# EasyEDA Pro project realtix-sakura_nfc-d968f2f9.epro, board PCB5
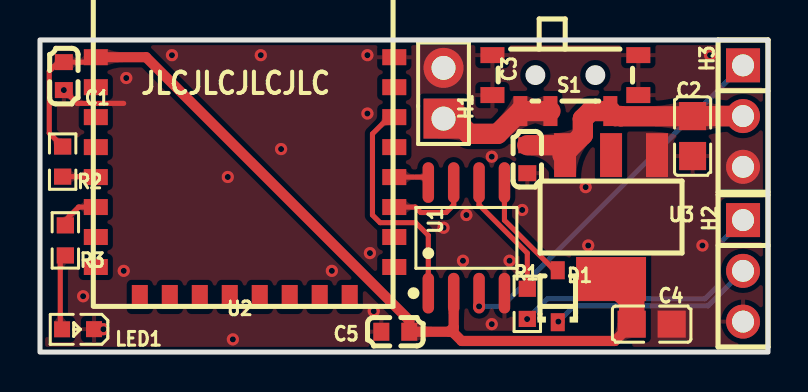
[diagram p10: board, top side]
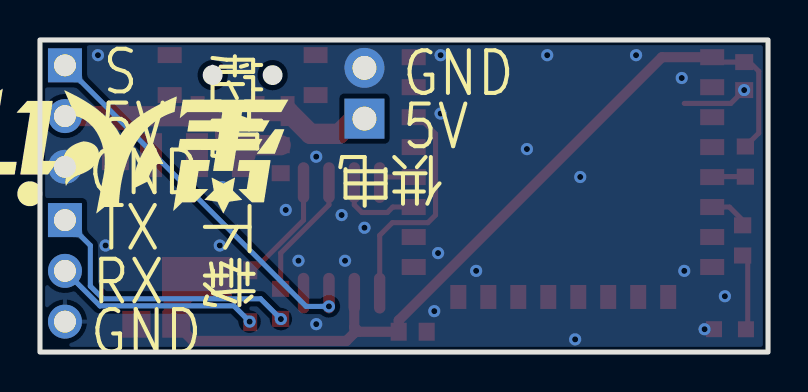
[diagram p11: board, bottom side, seen from below]

Outline 36.43 x 15.62 mm; copper layers: Top Layer, Bottom Layer. Coordinates in mm from the lower left corner of the outline.
Outline path: rectangle 0,15.62 36.43,0
Stack: Top Layer 0.035mm / SUBSTRATE1 1.51mm FR4 er 4.5 / Bottom Layer 0.035mm

## Design rules (mm)
spacing copperThickness1oz (default): track to track 0.102, other pairs 0.152 to 0.3
spacing copperThickness2oz: track to track 0.203, other pairs 0.152 to 0.3
spacing Plane_innerPlane: track to track 0.102, other pairs 0.152 to 0.3
spacing Copper_copperRegion: track to track 0.102, other pairs 0.152 to 0.3
track width copperThickness1oz (default): min 0.127, default 0.254, max 2.54
track width copperThickness2oz: min 0.203, default 0.254, max 2.54
differential pair differentialPair (default): width min 0.127, default 0.254, max 2.54; gap min 0.152, default 0.152
pour e106 uses Copper_copperRegion
pour e143 uses Copper_copperRegion

## Placement (name value [footprint] x y rotation side)
C1  100nF  [C0603]  1.19 13.81 90 top
C2  22uF  [C0805]  32.66 10.81 270 top
C3  100nF  [C0603]  24.38 9.65 270 top
C4  10uF  [C0805]  30.61 1.4 180 top
C5  100nF  [C0603]  17.78 1.02 0 top
D1  1N5819WS S4  [SOD-323_L1.6-W1.3-LS2.7-RD]  25.91 2.79 90 top
H1  PZ254V-11-02P  [HDR-TH_2P-P2.54-V-M]  20.19 12.95 90 top
H2  PZ254V-11-03P  [HDR-TH_3P-P2.54-V-M]  35.18 4.06 270 top
H3  PZ254V-11-03P  [HDR-TH_3P-P2.54-V-M]  35.18 11.81 270 top
LED1  NCD0603R1  [LED0603-RD_RED]  1.91 1.14 180 top
R1  100R  [R0603]  24.38 2.41 270 top
R2  10K  [R0603]  1.13 9.53 90 top
R3  2K  [R0603]  1.27 5.59 90 top
S1  -  [SW-SMD_PCM12SMTR]  26.29 13.46 180 top
U1  STC8G1K08A-36I-SOP8  [SOP-8_L5.0-W4.0-P1.27-LS6.0-BL]  21.34 5.71 0 top
U2  c7d8e8fd7018443ebd857dee17b1e269  [JDY-25M]  17.78 2.29 90 top
U3  -  [SOT_223]  28.57 6.73 180 top

## Footprints (pads in the part's own frame, mm; a bottom-side part is the same pattern mirrored in y, then rotated)
C0603
  rect 0.8x0.9 smd: 1(-0.7,0) 2(0.7,0)
C0805
  rect 1.41x1.35 smd: 1(-1,0) 2(1,0)
HDR-TH_2P-P2.54-V-M
  rect 2x2 hole 1.2: 1(-1.27,0)
  round 2 hole 1.2: 2(1.27,0)
HDR-TH_3P-P2.54-V-M
  rect 1.7x1.7 hole 1.1: 1(-2.54,0)
  round 1.7 hole 1.1: 2(0,0) 3(2.54,0)
JDY-25M
  rect 0.8x1.2 smd: 1(12.472,14.986) 2(10.972,14.986) 3(9.472,14.986) 4(7.971,14.986) 5(6.471,14.986) 6(4.971,14.986) 7(3.471,14.986) 8(1.972,14.986) 17(1.972,0.051) 18(3.471,0.051) 19(4.971,0.051) 20(6.471,0.051) 21(7.971,0.051) 22(9.472,0.051) 23(10.972,0.051) 24(12.472,0.051)
  rect 1.2x0.8 smd: 9(0.471,12.784) 10(0.471,11.284) 11(0.471,9.784) 12(0.471,8.284) 13(0.471,6.784) 14(0.471,5.284) 15(0.471,3.784) 16(0.471,2.284)
LED0603-RD_RED
  rect 0.8x0.8 smd: 1(-0.799,-0.004) 2(0.799,0.004)
R0603
  rect 0.806x0.864 smd: 1(-0.753,0) 2(0.753,0)
SOD-323_L1.6-W1.3-LS2.7-RD
  rect 0.9x0.7 smd: 1(-1.3,0) 2(1.3,0)
SOP-8_L5.0-W4.0-P1.27-LS6.0-BL
  oval 0.574x2.035 smd: 1(-1.905,-2.768) 2(-0.635,-2.768) 3(0.635,-2.768) 4(1.905,-2.768) 5(1.905,2.768) 6(0.635,2.768) 7(-0.635,2.768) 8(-1.905,2.768)
SOT_223
  rect 1.1x2.2 smd: 1(-2.299,-3.126) 2(0,-3.126) 3(2.301,-3.126)
  rect 3.5x2.2 smd: 4(0,3.072)
SW-SMD_PCM12SMTR
  rect 0.7x1.5 smd: 1(-2.25,1.4) 2(0.75,1.4) 3(2.25,1.4)
  rect 1.2x0.8 smd: 4(-3.65,0.6) 4(-3.65,-1.4) 4(3.65,0.6) 4(3.65,-1.4)

## Nets
As in the schematic.

Pads without a net: U2 2 3 4 9 14 15; U3 2

## Via types
v1: diameter 0.61, hole 0.305, Top Layer to Bottom Layer, 29 vias

## Routing (per net, layer and track width the routed paths; a pad name or vN(x,y) marks a point on that pad's centre or on a via; arc(x,y) is an arc through that point)
3V3: length 44.8
  Top Layer w0.254: R2.2 0.47,10.95 0.47,14.05 0.92,14.51 C1.2 2.55,14.51 U2.1
  Top Layer w0.508: 20.7,2.95 20.7,1.25 ; 20.7,1.25 20.47,1.02 C5.2 18.48,1.59 5.31,14.76 U2.1 ; 20.7,1.25 20.7,0.95 21.1,0.55 28.76,0.55 C4.2
  Top Layer w1.27: U3.4 29.61,2.63 C4.2
+5V: length 6.1
  Top Layer w1.016: H1.1 20.7,11.68 21.46,10.92 22.9,10.92 S1.3 S1.2
GND: length 3.3
  Top Layer w0.254: v1(1.19,13.11) 1.86,12.45 4.19,12.45
  vias: v1(2.16,2.79) v1(3.18,1.14) v1(4.19,4.06) v1(4.32,13.72) v1(6.6,14.86) v1(9.4,8.76) v1(9.65,0.63) v1(11.05,14.86) v1(12.06,10.16) v1(14.6,4.06) v1(16.38,14.86) v1(16.38,11.94) v1(16.51,4.95) v1(16.7,2.05) v1(20.19,6.22) v1(21.16,4.57) v1(21.34,6.86) v1(22.61,9.78) v1(22.61,1.4) v1(23.5,4.57) v1(24.13,7.11) v1(27.31,8.25) v1(27.43,5.33) v1(33.15,5.33) v1(33.53,14.86)
VCC: length 12.7
  Top Layer w1.016: C3.1 26.2,10.35 26.42,10.13 ; H3.2 C2.1 32.65,11.8 29.07,11.8 29.06,11.81 28.79,11.81 S1.1 27.56,12.06 27.16,11.67 27.16,10.87 26.42,10.13 ; 26.42,10.13 26.15,9.86
JDY_IN5: length 1.7
  Top Layer w0.254: U2.5 2.77,8.78 1.13,8.78
JDY_PWRC: length 11.6
  Top Layer w0.254: U1.1 19.43,5.84 18.8,6.48 17.02,6.48 16.64,6.86 16.64,10.92 17.47,11.76 U2.22
JDY_RX: length 1.8
  Top Layer w0.254: U2.20 19.16,8.76 U1.8
JDY_STAT: length 2.2
  Top Layer w0.254: U2.6 1.93,7.26 1.02,6.34
JDY_TX: length 4.4
  Top Layer w0.254: U2.19 18.78,7.26 19.05,6.98 20.32,6.98 20.7,7.37 20.7,8.48
P3.0(RX): length 5.7
  Top Layer w0.254: U1.5 23.24,6.6 25.83,4.01 D1.2
P3.1(TX): length 6.3
  Top Layer w0.254: U1.6 21.97,7.37 24.38,4.95 R1.1
P5.5: length 18.2
  Bottom Layer w0.254: H3.1 23.11,2.29 v1(21.97,2.29)
RX: length 10.3
  Top Layer w0.254: D1.1 v1(25.94,1.52)
  Bottom Layer w0.254: v1(25.94,1.52) 26.72,2.31 33.43,2.31 H2.2
TX: length 14
  Bottom Layer w0.254: H2.1 33.91,5.33 33.91,3.3 33.27,2.67 25.39,2.67 v1(24.38,1.65)
$1N2476: length 3.6
  Top Layer w0.254: 1.11,1.27 1.02,1.36 1.02,4.83

## Copper pours and planes (outline as drawn; the poured copper is in the pictures)
GND on Top Layer: -0.63,16.13 37.47,16.13 37.47,-1.14 -0.63,-1.14
GND on Bottom Layer: -1.52,16.51 39.24,16.51 39.24,-2.54 -1.52,-2.54

Small or netless copper shapes (teardrops, artwork), in the pictures only: 36 on Top Layer, 5 on Bottom Layer

## Text on the board
Bottom Silkscreen Layer: GND | 5V | S | TX | RX | 舵机 | 下载 | 供电
Top Silkscreen Layer: JLCJLCJLCJLC
